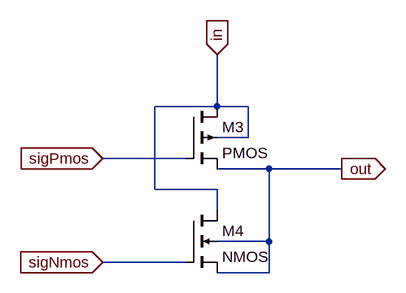
[diagram p0: schematic Transmissiongate.asc]
Transmissiongate.asc, the LTspice schematic file:
Version 4
SHEET 1 880 680
WIRE 432 176 432 96
WIRE 432 176 336 176
WIRE 480 176 432 176
WIRE 480 224 480 176
WIRE 480 224 432 224
WIRE 384 256 256 256
WIRE 512 272 432 272
WIRE 624 272 512 272
WIRE 336 304 336 176
WIRE 432 304 336 304
WIRE 432 336 432 304
WIRE 512 384 512 272
WIRE 512 384 432 384
WIRE 384 416 256 416
WIRE 512 432 512 384
WIRE 512 432 432 432
FLAG 432 96 in
IOPIN 432 96 In
FLAG 624 272 out
IOPIN 624 272 Out
FLAG 256 256 sigPmos
IOPIN 256 256 In
FLAG 256 416 sigNmos
IOPIN 256 416 In
SYMBOL pmos4 384 176 R0
SYMATTR InstName M3
SYMBOL nmos4 384 336 R0
SYMATTR InstName M4

The netlist it stands for:
* Transmissiongate.asc
M3 in sigPmos out in PMOS
M4 in sigNmos out out NMOS
.model NMOS NMOS
.model PMOS PMOS
.lib standard.mos
.backanno
.end